# Altium schematic sheet Sheet1.SchDoc
size A3; SheetNumber: 2; SheetTotal: 3
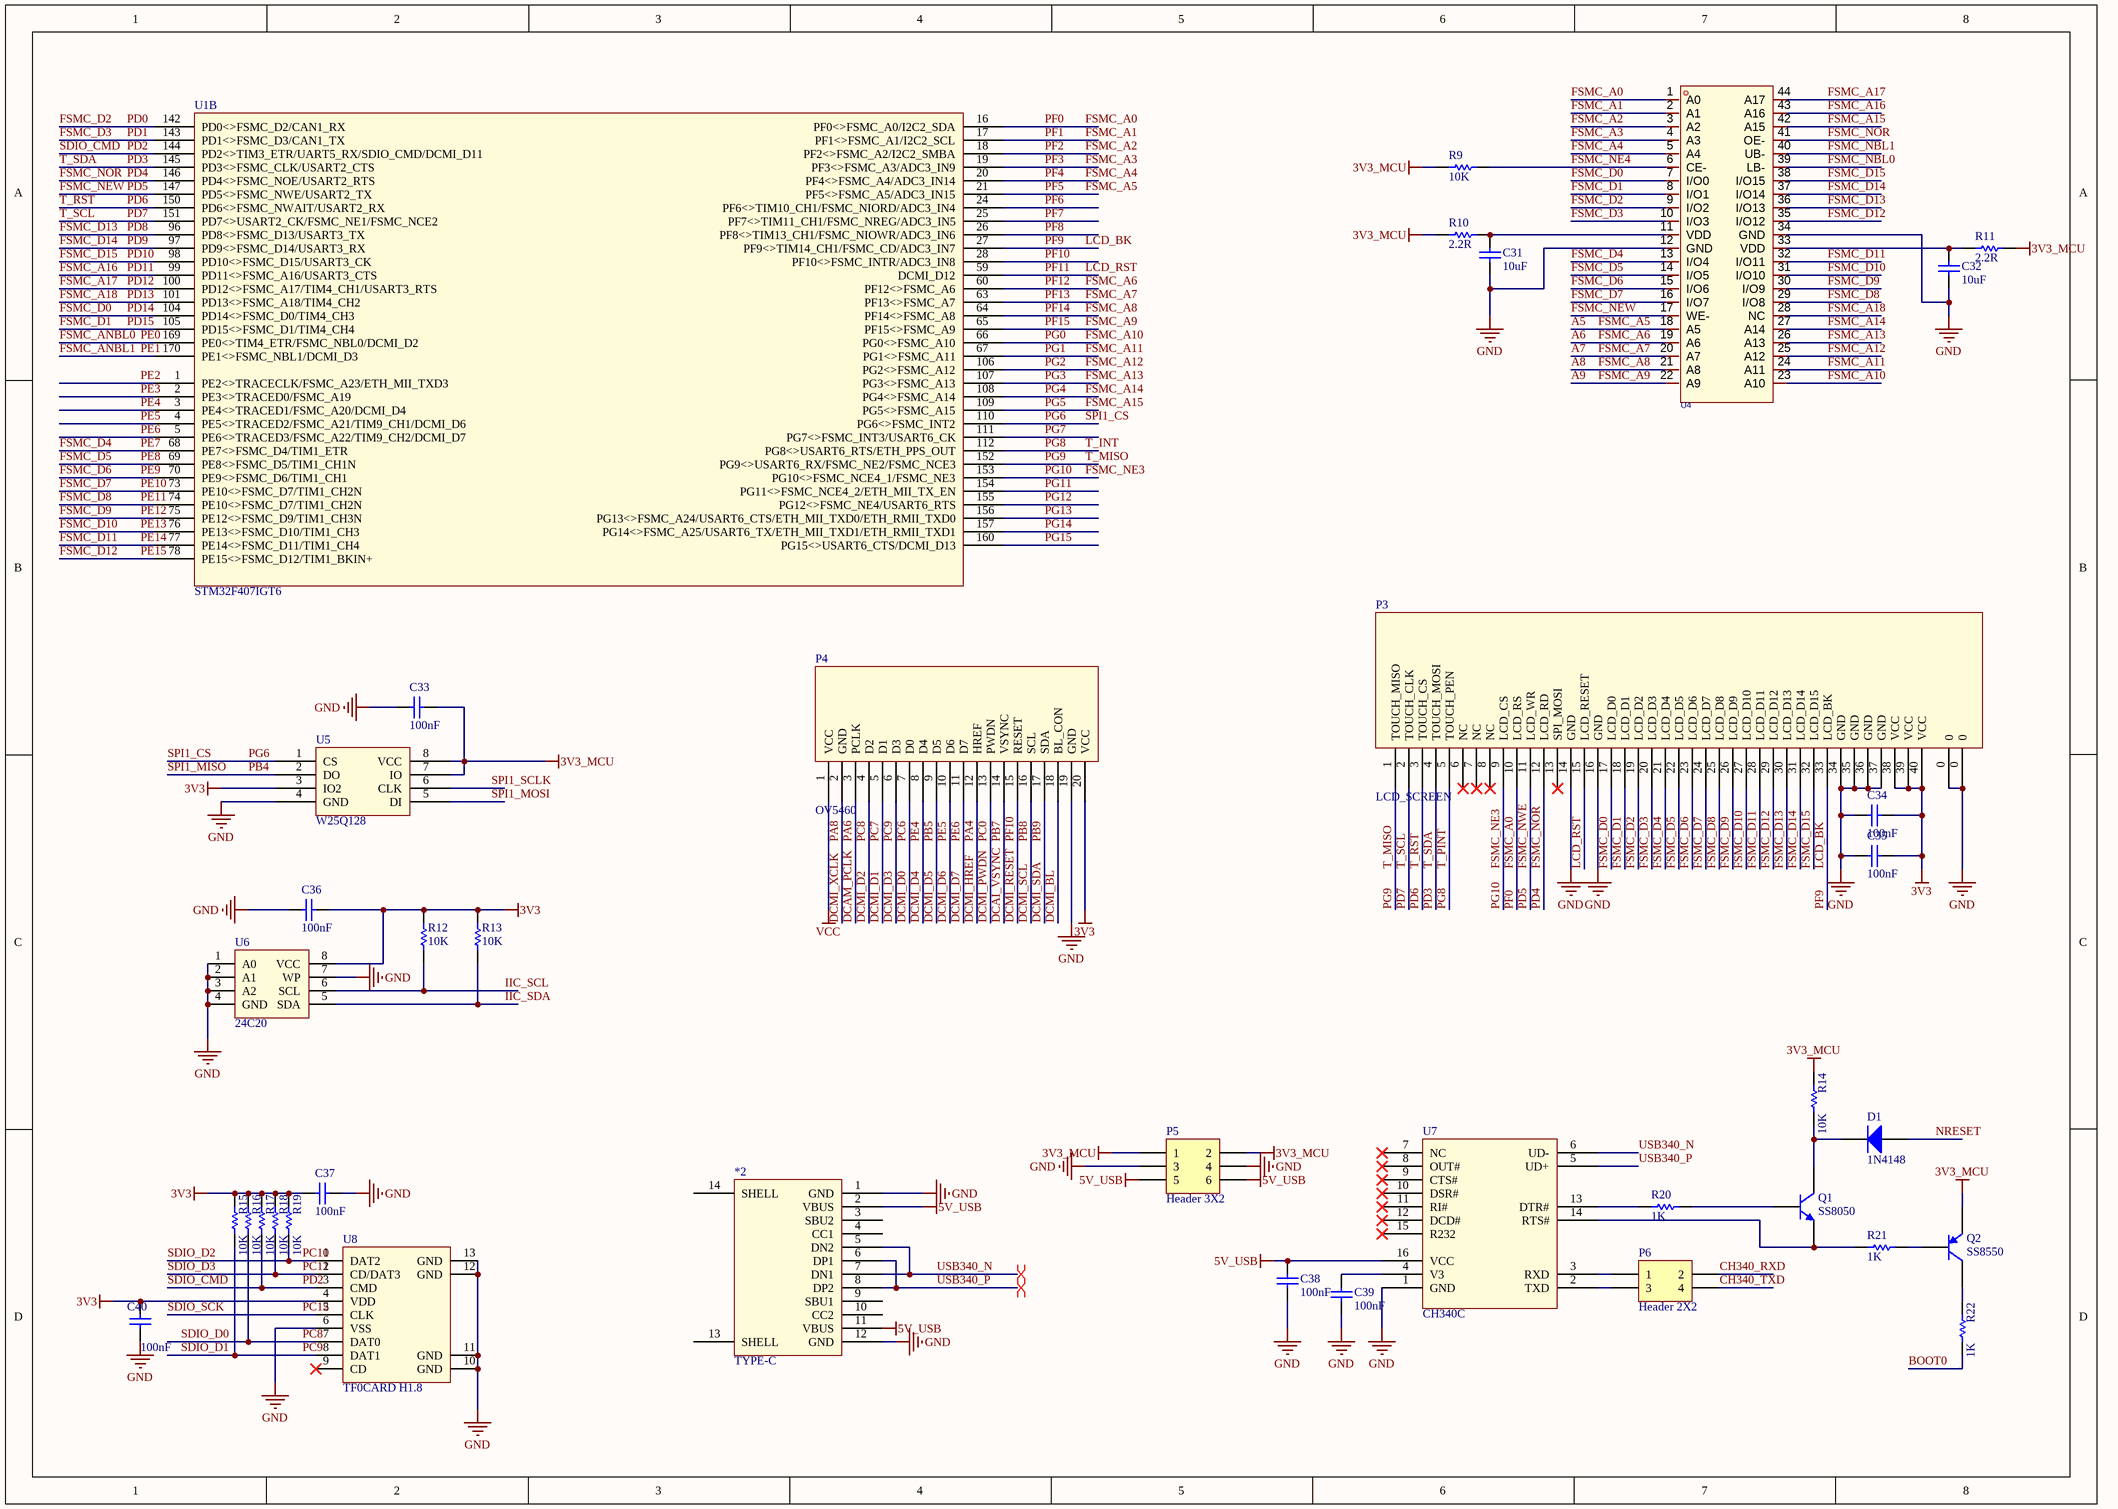
[diagram p0: Sheet1.SchDoc]

## Parts
*2  TYPE-C  [USB-C-SMD_TYPE-C-6PIN-2MD-073]
C31  10uF  [C0603]
C32  10uF  [C0603]
C33  100nF  [C0603]
C34  100nF  [C0603]
C35  100nF  [C0603]
C36  100nF  [C0603]
C37  100nF  [C0603]
C38  100nF  [C0603]
C39  100nF  [C0603]
C40  100nF  [C0603]
D1  1N4148  [SOD-123_L2.7-W1.6-LS3.7-FD]
P3  LCD_SCREEN  [FPC-SMD_P0.50-40P_FGS-XJ-H2.0]
P4  OV5460  [FPC-SMD_20P-P0.50_XUNPU_FPC-05F-20PH20]
P5  Header 3X2  [HDR2X3]
P6  Header 2X2  [HDR2X2]
Q1  SS8050  [SOT-23-3_L2.9-W1.3-P1.90-LS2.4-BR]
Q2  SS8550  [SOT-23-3_L2.9-W1.3-P1.90-LS2.4-BR]
R9  10K  [R0603]
R10  2.2R  [R0603]
R11  2.2R  [R0603]
R12  10K  [R0603]
R13  10K  [R0603]
R14  10K  [R0603]
R15  10K  [R0603]
R16  10K  [R0603]
R17  10K  [R0603]
R18  10K  [R0603]
R19  10K  [R0603]
R20  1K  [R0603]
R21  1K  [R0603]
R22  1K  [R0603]
U1  STM32F407IGT6  [LQFP-176_L24.0-W24.0-P0.50-BL]  (part B of 2)
U4  is61lv25616al-10tli-tr  [TSOP-44_L18.4-W10.2-P0.80-LS11.8-BL]  (value not drawn)
U5  W25Q128  [SOIC-8_L5.3-W5.3-P1.27-LS8.0-BL]
U6  24C20  [SOP-8_L5.0-W4.0-P1.27-LS6.0-BL]
U7  CH340C  [SOP-16_L10.0-W3.9-P1.27-LS6.0-BL]
U8  TF0CARD H1.8  [TF-SMD_TF-PUSH]

## Nets
3V3: C34.2 C35.2 C36.1 C37.2 C40.1 P3.38(VCC) P3.39(VCC) P3.40(VCC) P4.20(VCC) R12.2 R13.2 R15.2 R16.2 R17.2 R18.2 R19.2 U5.3(IO2) U6.8(VCC) U8.4(VDD)
3V3_MCU: C33.1 P5.1 P5.2 Q2.3(E) R9.1 R10.1 R11.2 R14.2 U5.7(IO) U5.8(VCC)
5V_USB: *2.2(VBUS) *2.11(VBUS) C38.2 P5.5 P5.6 U7.16(VCC)
GND: *2.1(GND) *2.12(GND) C31.1 C32.1 C33.2 C34.1 C35.1 C36.2 C37.1 C38.1 C39.1 C40.2 P3.0 P3.14(GND) P3.16(GND) P3.34(GND) P3.35(GND) P3.36(GND) P3.37(GND) P4.19(GND) P5.3 P5.4 U4.12(GND) U4.34(GND) U5.4(GND) U6.1(A0) U6.2(A1) U6.3(A2) U6.4(GND) U6.7(WP) U7.1(GND) U8.6(VSS) U8.10(GND) U8.11(GND) U8.12(GND) U8.13(GND)
VCC: P4.1(VCC)
A5: U1.21(PF5<>FSMC_A5/ADC3_IN15) U4.18(A5)  [also labelled FSMC_A5, PF5]
A6: U1.60(PF12<>FSMC_A6) U4.19(A6)  [also labelled FSMC_A6, PF12]
A7: U1.63(PF13<>FSMC_A7) U4.20(A7)  [also labelled FSMC_A7, PF13]
A8: U1.64(PF14<>FSMC_A8) U4.21(A8)  [also labelled FSMC_A8, PF14]
A9: U1.65(PF15<>FSMC_A9) U4.22(A9)  [also labelled FSMC_A9, PF15]
BOOT0: R22.1
CH340_RXD: P6.2
CH340_TXD: P6.4
DCAI_VSYNC: P4.14(VSYNC)  [also labelled PB7]
DCAM_PCLK: P4.3(PCLK)  [also labelled PA6]
DCMI_BL: P4.18(BL_CON)
DCMI_D0: P4.7(D0)  [also labelled PC6]
DCMI_D1: P4.5(D1)  [also labelled PC7]
DCMI_D2: P4.4(D2) R16.1 U8.7(DAT0)  [also labelled PC8, SDIO_D0]
DCMI_D3: P4.6(D3) R15.1 U8.8(DAT1)  [also labelled PC9, SDIO_D1]
DCMI_D4: P4.8(D4) U1.3(PE4<>TRACED1/FSMC_A20/DCMI_D4)  [also labelled PE4]
DCMI_D5: P4.9(D5)  [also labelled PB5]
DCMI_D6: P4.10(D6) U1.4(PE5<>TRACED2/FSMC_A21/TIM9_CH1/DCMI_D6)  [also labelled PE5]
DCMI_D7: P4.11(D7) U1.5(PE6<>TRACED3/FSMC_A22/TIM9_CH2/DCMI_D7)  [also labelled PE6]
DCMI_HREF: P4.12(HREF)  [also labelled PA4]
DCMI_PWDN: P4.13(PWDN)  [also labelled PC0]
DCMI_RESET: P4.15(RESET) U1.28(PF10<>FSMC_INTR/ADC3_IN8)  [also labelled PF10]
DCMI_SCL: P4.16(SCL)  [also labelled PB8]
DCMI_SDA: P4.17(SDA)  [also labelled PB9]
DCMI_XCLK: P4.2(GND)  [also labelled PA8]
FSMC_A0: P3.10(LCD_RS) U1.16(PF0<>FSMC_A0/I2C2_SDA) U4.1(A0)  [also labelled PF0]
FSMC_A1: U1.17(PF1<>FSMC_A1/I2C2_SCL) U4.2(A1)  [also labelled PF1]
FSMC_A2: U1.18(PF2<>FSMC_A2/I2C2_SMBA) U4.3(A2)  [also labelled PF2]
FSMC_A3: U1.19(PF3<>FSMC_A3/ADC3_IN9) U4.4(A3)  [also labelled PF3]
FSMC_A4: U1.20(PF4<>FSMC_A4/ADC3_IN14) U4.5(A4)  [also labelled PF4]
FSMC_A10: U1.66(PG0<>FSMC_A10) U4.23(A10)  [also labelled PG0]
FSMC_A11: U1.67(PG1<>FSMC_A11) U4.24(A11)  [also labelled PG1]
FSMC_A12: U1.106(PG2<>FSMC_A12) U4.25(A12)  [also labelled PG2]
FSMC_A13: U1.107(PG3<>FSMC_A13) U4.26(A13)  [also labelled PG3]
FSMC_A14: U1.108(PG4<>FSMC_A14) U4.27(A14)  [also labelled PG4]
FSMC_A15: U1.109(PG5<>FSMC_A15) U4.42(A15)  [also labelled PG5]
FSMC_A16: U1.99(PD11<>FSMC_A16/USART3_CTS) U4.43(A16)  [also labelled PD11]
FSMC_A17: U1.100(PD12<>FSMC_A17/TIM4_CH1/USART3_RTS) U4.44(A17)  [also labelled PD12]
FSMC_A18: U1.101(PD13<>FSMC_A18/TIM4_CH2) U4.28(NC)  [also labelled PD13]
FSMC_ANBL0: U1.169(PE0<>TIM4_ETR/FSMC_NBL0/DCMI_D2)  [also labelled PE0]
FSMC_ANBL1: U1.170(PE1<>FSMC_NBL1/DCMI_D3)  [also labelled PE1]
FSMC_D0: P3.17(LCD_D0) U1.104(PD14<>FSMC_D0/TIM4_CH3) U4.7(I/O0)  [also labelled PD14]
FSMC_D1: P3.18(LCD_D1) U1.105(PD15<>FSMC_D1/TIM4_CH4) U4.8(I/O1)  [also labelled PD15]
FSMC_D2: P3.19(LCD_D2) U1.142(PD0<>FSMC_D2/CAN1_RX) U4.9(I/O2)  [also labelled PD0]
FSMC_D3: P3.20(LCD_D3) U1.143(PD1<>FSMC_D3/CAN1_TX) U4.10(I/O3)  [also labelled PD1]
FSMC_D4: P3.21(LCD_D4) U1.68(PE7<>FSMC_D4/TIM1_ETR) U4.13(I/O4)  [also labelled PE7]
FSMC_D5: P3.22(LCD_D5) U1.69(PE8<>FSMC_D5/TIM1_CH1N) U4.14(I/O5)  [also labelled PE8]
FSMC_D6: P3.23(LCD_D6) U1.70(PE9<>FSMC_D6/TIM1_CH1) U4.15(I/O6)  [also labelled PE9]
FSMC_D7: P3.24(LCD_D7) U1.73(PE10<>FSMC_D7/TIM1_CH2N) U4.16(I/O7)  [also labelled PE10]
FSMC_D8: P3.25(LCD_D8) U1.74(PE10<>FSMC_D7/TIM1_CH2N) U4.29(I/O8)  [also labelled PE11]
FSMC_D9: P3.26(LCD_D9) U1.75(PE12<>FSMC_D9/TIM1_CH3N) U4.30(I/O9)  [also labelled PE12]
FSMC_D10: P3.27(LCD_D10) U1.76(PE13<>FSMC_D10/TIM1_CH3) U4.31(I/O10)  [also labelled PE13]
FSMC_D11: P3.28(LCD_D11) U1.77(PE14<>FSMC_D11/TIM1_CH4) U4.32(I/O11)  [also labelled PE14]
FSMC_D12: P3.29(LCD_D12) U1.78(PE15<>FSMC_D12/TIM1_BKIN+) U4.35(I/O12)  [also labelled PE15]
FSMC_D13: P3.30(LCD_D13) U1.96(PD8<>FSMC_D13/USART3_TX) U4.36(I/O13)  [also labelled PD8]
FSMC_D14: P3.31(LCD_D14) U1.97(PD9<>FSMC_D14/USART3_RX) U4.37(I/O14)  [also labelled PD9]
FSMC_D15: P3.32(LCD_D15) U1.98(PD10<>FSMC_D15/USART3_CK) U4.38(I/O15)  [also labelled PD10]
FSMC_NBL0: U4.39(LB-)
FSMC_NBL1: U4.40(UB-)
FSMC_NE3: P3.9(LCD_CS) U1.153(PG10<>FSMC_NCE4_1/FSMC_NE3)  [also labelled PG10]
FSMC_NE4: R9.2 U4.6(CE-)
FSMC_NEW: P3.11(LCD_WR) U1.147(PD5<>FSMC_NWE/USART2_TX) U4.17(WE-)  [also labelled FSMC_NWE, PD5]
FSMC_NOR: P3.12(LCD_RD) U1.146(PD4<>FSMC_NOE/USART2_RTS) U4.41(OE-)  [also labelled PD4]
IIC_SCL: R12.1 U6.6(SCL)
IIC_SDA: R13.1 U6.5(SDA)
LCD_BK: P3.33(LCD_BK) U1.27(PF9<>TIM14_CH1/FSMC_CD/ADC3_IN7)  [also labelled PF9]
LCD_RST: P3.15(LCD_RESET) U1.59(DCMI_D12)  [also labelled PF11]
NRESET: D1.1(A)
PB4: U5.2(DO)  [also labelled SPI1_MISO]
PC10: R19.1 U8.1(DAT2)  [also labelled SDIO_D2]
PC11: R18.1 U8.2(CD/DAT3)  [also labelled SDIO_D3]
PC12: U8.5(CLK)  [also labelled SDIO_SCK]
PD2: R17.1 U1.144(PD2<>TIM3_ETR/UART5_RX/SDIO_CMD/DCMI_D11) U8.3(CMD)  [also labelled SDIO_CMD]
PD3: P3.4(TOUCH_MOSI) U1.145(PD3<>FSMC_CLK/USART2_CTS)  [also labelled T_SDA, T_SD~{A}]
PD6: P3.3(TOUCH_CS) U1.150(PD6<>FSMC_NWAIT/USART2_RX)  [also labelled T_RST]
PD7: P3.2(TOUCH_CLK) U1.151(PD7<>USART2_CK/FSMC_NE1/FSMC_NCE2)  [also labelled T_SCL]
PE2: U1.1(PE2<>TRACECLK/FSMC_A23/ETH_MII_TXD3)
PE3: U1.2(PE3<>TRACED0/FSMC_A19)
PF6: U1.24(PF6<>TIM10_CH1/FSMC_NIORD/ADC3_IN4)
PF7: U1.25(PF7<>TIM11_CH1/FSMC_NREG/ADC3_IN5)
PF8: U1.26(PF8<>TIM13_CH1/FSMC_NIOWR/ADC3_IN6)
PG6: U1.110(PG6<>FSMC_INT2) U5.1(CS)  [also labelled SPI1_CS]
PG7: U1.111(PG7<>FSMC_INT3/USART6_CK)
PG8: P3.5(TOUCH_PEN) U1.112(PG8<>USART6_RTS/ETH_PPS_OUT)  [also labelled T_INT, T_PINT]
PG9: P3.1(TOUCH_MISO) U1.152(PG9<>USART6_RX/FSMC_NE2/FSMC_NCE3)  [also labelled T_MISO]
PG11: U1.154(PG11<>FSMC_NCE4_2/ETH_MII_TX_EN)
PG12: U1.155(PG12<>FSMC_NE4/USART6_RTS)
PG13: U1.156(PG13<>FSMC_A24/USART6_CTS/ETH_MII_TXD0/ETH_RMII_TXD0)
PG14: U1.157(PG14<>FSMC_A25/USART6_TX/ETH_MII_TXD1/ETH_RMII_TXD1)
PG15: U1.160(PG15<>USART6_CTS/DCMI_D13)
SPI1_MOSI: U5.5(DI)
SPI1_SCLK: U5.6(CLK)
USB340_N: *2.5(DN2) *2.7(DN1) U7.6(UD-)
USB340_P: *2.6(DP1) *2.8(DP2) U7.5(UD+)
NetC31_2: C31.2 R10.2 U4.11(VDD)
NetC32_2: C32.2 R11.1 U4.33(VDD)
NetC39_2: C39.2 U7.4(V3)
NetD1_2: D1.2(K) Q1.1(C) R14.1
NetP6_1: P6.1 U7.3(RXD)
NetP6_3: P6.3 U7.2(TXD)
NetQ1_2: Q1.2(B) R20.1
NetQ1_3: Q1.3(E) R21.2 U7.14(RTS#)
NetQ2_1: Q2.1(C) R22.2
NetQ2_2: Q2.2(B) R21.1
NetR20_2: R20.2 U7.13(DTR#)

Not connected (* = marked no-connect by the designer): *2 3(SBU2) 4(CC1) 9(SBU1) 10(CC2) 13(SHELL) 14(SHELL); P3 6(NC)* 7(NC)* 8(NC)* 13(SPI_MOSI)*; U7 7(NC)* 8(OUT#)* 9(CTS#)* 10(DSR#)* 11(RI#)* 12(DCD#)* 15(R232)*; U8 9(CD)*

## Layout directives
differential pair: USB340_N, USB340_P

## Library data of the parts
C31-C40 = Cap: Capacitor; Value: 100pF; Published: 8-Jun-2000; LatestRevisionDate: 17-Jul-2002; LatestRevisionNote: Re-released for DXP Platform.; PackageReference: RAD-0.3; Publisher: Altium Limited; PackageDescription: Radial Cap, Thru-Hole; 2 Leads; 0.3 in Pin Spacing
D1 = Diode 1N4148: High Conductance Fast Diode; Published: 8-Jun-2000; LatestRevisionDate: 17-Jul-2002; LatestRevisionNote: Re-released for DXP Platform.; DatasheetVersion: 1997; PackageReference: DO-35; Publisher: Altium Limited; PackageDescription: Diode, Axial; Body 3.8 x 1.9 mm (LxDia. max), Lead Dia. 0.53 mm (max); Code_JEDEC: DO-204-AH; ComponentLink1Description: Manufacturer Link; ComponentLink1URL: http://www.fairchildsemi.com/; ComponentLink2Description: Datasheet; ComponentLink2URL: http://www.fairchildsemi.com/ds/1N%2F1N4148.pdf
P5 = Header 3X2: Header, 3-Pin, Dual row; LatestRevisionDate: 17-Jul-2002; LatestRevisionNote: Re-released for DXP Platform.; Publisher: Altium Limited
P6 = Header 2X2: Header, 2-Pin, Dual row; LatestRevisionDate: 17-Jul-2002; LatestRevisionNote: Re-released for DXP Platform.; Publisher: Altium Limited
Q1 = NPN: NPN Bipolar Transistor; Published: 8-Jun-2000; LatestRevisionDate: 17-Jul-2002; LatestRevisionNote: Re-released for DXP Platform.; PackageReference: TO-226-AA; Publisher: Altium Limited; PackageDescription: TO, Flat Index; 3 In-Line, Axial Leads; Body Dia. 4.8mm; Leads 0.55 x 0.51 mm (max); Code_JEDEC: TO-226-AA
Q2 = PNP: PNP Bipolar Transistor; Published: 8-Jun-2000; LatestRevisionDate: 29-May-2009; LatestRevisionNote: IPC-7351 Footprint Added.; PackageVersion: Aug-1999; PackageReference: SOT-23B; Publisher: Altium Limited; PackageDescription: 3-Pin SOT-23 Package 0.95 mm Pitch, 2.4 mm Lead Span
R9-R19 = Res1: Resistor; Value: 1K; Published: 8-Jun-2000; LatestRevisionDate: 17-Jul-2002; LatestRevisionNote: Re-released for DXP Platform.; PackageReference: AXIAL-0.3; Publisher: Altium Limited; PackageDescription: Axial Device, Thru-Hole; 2 Leads; 0.3 in Pin Spacing
R20-R22 = Res1: Resistor; Published: 8-Jun-2000; LatestRevisionDate: 17-Jul-2002; LatestRevisionNote: Re-released for DXP Platform.; PackageReference: AXIAL-0.3; Publisher: Altium Limited; PackageDescription: Axial Device, Thru-Hole; 2 Leads; 0.3 in Pin Spacing; Value: 1K
U1 = STM32F407IGT6: mcu
U4 = is61lv25616al-10tli-tr: 存储容量:4Mbit;工作电压:3.3V~3.63V;; Manufacturer: ISSI(北京矽成); AddInBom: yes; ModelId: 560eb33016ce4e308706c564a2ec9c3c; ModelName: TSOP-44_L18.4-W10.2-H1.0-LS11.8-P0.80; ModelTransform: 465.06033,724.408,0,90,0,0,0,-0.0005,0; Interface: 并口(Parallel); Memory Size: 4Mbit; Access Time: 10ns; Supply Current (Icc): 110mA; Standby Current (Iq): 20mA; LCSC Part Name: IS61LV25616AL 10TLI TR; SupplierPart: C2063046; ManufacturerPart: IS61LV25616AL-10TLI-TR; Supplier Footprint: TSOPII-44-10.2mm; JLCPCB Part Class: Extended Part; Datasheet: https://item.szlcsc.com/datasheet/IS61LV25616AL-10TLI-TR/2154619.html; Supplier: LCSC; ConvertToPcb: yes; SymbolName: IS61LV25616AL-10TLI-TR; FootprintName: TSOP-44_L18.4-W10.2-P0.80-LS11.8-BL; Voltage - Supply: 3.3V~3.63V; Operating Temperature: -40℃~+85℃; Features: 自动掉电功能
U6 = 24C20: EEPROM